# Altium schematic sheet Sheet2_Hierarquia.SchDoc
size A4; SheetNumber: 1; SheetTotal: 6
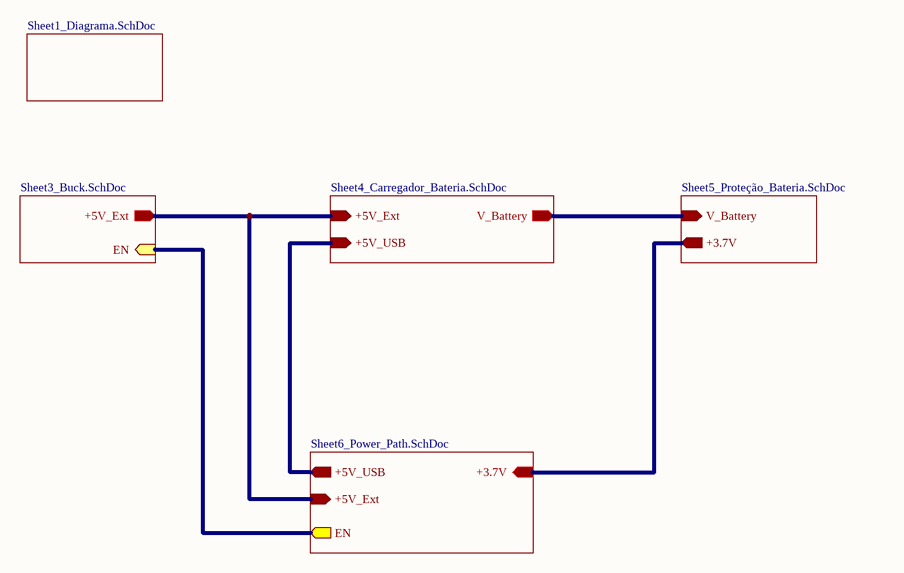
[diagram p0: Sheet2_Hierarquia.SchDoc]

## Parts
?  (no value)  (graphical)

## Sub-sheets
Sheet3 = Sheet3_Buck.SchDoc: EN (in), +5V_Ext (out)
Sheet3 = Sheet1_Diagrama.SchDoc: no entries
Sheet4 = Sheet4_Carregador_Bateria.SchDoc: V_Battery (out), +5V_Ext (in), +5V_USB (in)
Sheet5 = Sheet5_Proteção_Bateria.SchDoc: V_Battery (in), +3.7V (out)
Sheet6 = Sheet6_Power_Path.SchDoc: +3.7V (in), +5V_USB (out), EN (out), +5V_Ext (in)

## Nets
(unnamed): sheet Sheet3/EN, sheet Sheet6/EN
(unnamed): sheet Sheet3/+5V_Ext, sheet Sheet4/+5V_Ext, sheet Sheet6/+5V_Ext
(unnamed): sheet Sheet5/V_Battery, sheet Sheet4/V_Battery
(unnamed): sheet Sheet5/+3.7V, sheet Sheet6/+3.7V
(unnamed): sheet Sheet4/+5V_USB, sheet Sheet6/+5V_USB

## Notes on the sheet
- Título:
- Endereço:
- Rua Aprígio Veloso, 1500 - Bodocongó
  CEP:58.429-140
  Campina Grande, Paraíba
  Brasil
- Projeto:
- Conta:
- Projetista:
- Arquivo:
- Data:
- Revisor:
- Pág.:
- Rev.:
- de

## Library data of the parts
? = Title Block